# Altium schematic sheet CW341_HeatsinkFan.SchDoc: Heatsink and Fan
size Letter; Organization: NewAE Technology Inc.; Address1: 1083 Queen St., Suite 196; Address2: Halifax; Address3: NS; Address4: Canada B3H 0B2; SheetNumber: 11; SheetTotal: 16; SheetApproved: YES
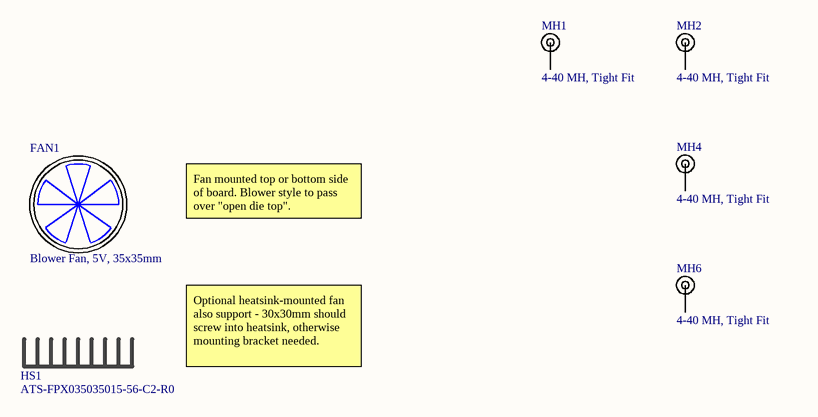
[diagram p0: CW341_HeatsinkFan.SchDoc]

## Parts
FAN1  Blower Fan, 5V, 35x35mm  [BFB03505HHA-A]
HS1  ATS-FPX035035015-56-C2-R0  [ATS-FPX035035015-56-C2-R0]
MH1  4-40 MH, Tight Fit  [MOUNT_#4_TIGHT]
MH2  4-40 MH, Tight Fit  [MOUNT_#4_TIGHT]
MH4  4-40 MH, Tight Fit  [MOUNT_#4_TIGHT]
MH6  4-40 MH, Tight Fit  [MOUNT_#4_TIGHT]

## Nets

Not connected (* = marked no-connect by the designer): HS1 MH; MH1 1; MH2 1; MH4 1; MH6 1

## Notes on the sheet
- Fan mounted top or bottom side of board. Blower style to pass over "open die top".
- Optional heatsink-mounted fan also support - 30x30mm should screw into heatsink, otherwise mounting bracket needed.
- Title:
- Date:
- Rev:
- Time:
- Project:
- Sheet
- of
- License:
- Copyright © NewAE Technology Inc.
- Approved:
- NewAE.com
- File:

## Library data of the parts
FAN1 = BFB03505HHA-A: Manufacture 1: Delta Fans; Component Group: Mechanical; PP Material Stack: 0; Part Number: BFB03505HHA-A; Manufacture Part Number 1: BFB03505HHA-A; Component Kind: Standard; Component Type: Standard; PP Rotation: 0; PP Rotation1: 0
HS1 = ATS-FPX035035015-56-C2-R0: Heatsink, 35mm square; Manufacture 1: ATS; Component Group: Mechanical; PP Material Stack: 0; Part Number: ATS-FPX035035015-56-C2-R0; Manufacture Part Number 1: ATS-FPX035035015-56-C2-R0; Supplier 1: Digi-Key; Component Kind: Standard; Component Type: Standard; PP Rotation: 0; PP Rotation1: 0
MH1 MH2 MH4 MH6 = MOUNT_#4_TIGHT: Machine screw 4-40 Mounting Hole; Component Group: Mechanical; PP Material Stack: 0; Part Number: MOUNT_#4_TIGHT; Pin Count: 1; Component Kind: Mechanical; Component Type: Mechanical; PP Rotation: 0